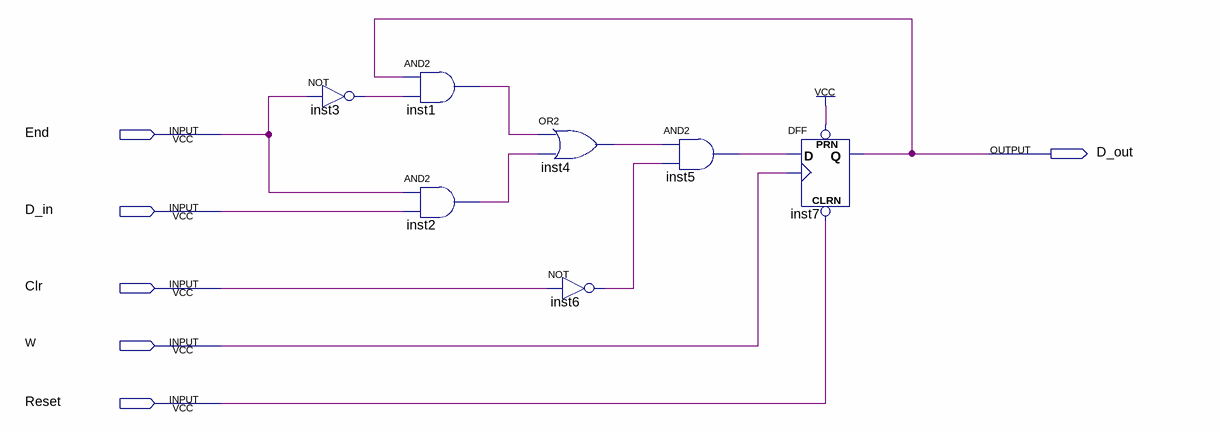
[diagram p0: schematic sheet]
// Quartus schematic memoria.bdf as structural Verilog: 7 symbols, 6 pins
module memoria (
  input  End,
  input  D_in,
  input  Clr,
  input  W,
  input  Reset,
  output D_out
);

  wire inst1_out, inst2_out, inst3_out, inst4_out, inst5_out, inst6_out;

  not inst3 (inst3_out, End);
  and inst1 (inst1_out, D_out, inst3_out);
  and inst2 (inst2_out, End, D_in);
  or inst4 (inst4_out, inst1_out, inst2_out);
  not inst6 (inst6_out, Clr);
  and inst5 (inst5_out, inst4_out, inst6_out);
  DFF inst7 (.CLRN(Reset), .CLK(W), .D(inst5_out), .PRN(1'b1), .Q(D_out));
endmodule
